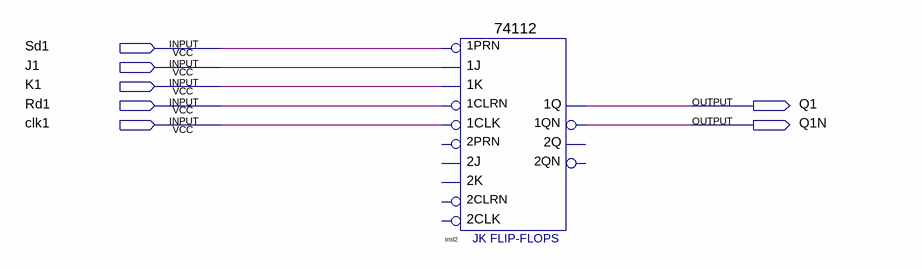
[diagram p0: schematic sheet]
// Quartus schematic exp5_t2_74112.bdf as structural Verilog: 1 symbols, 7 pins
module exp5_t2_74112 (
  input  Sd1,
  input  J1,
  input  K1,
  input  Rd1,
  input  clk1,
  output Q1,
  output Q1N
);

  \74112  inst2 (
    .\1K (K1), .\1J (J1), .\1PRN (Sd1), .\1CLK (clk1), .\1CLRN (Rd1), .\1QN (Q1N), .\1Q (Q1));  // open: 2K, 2J, 2PRN, 2CLK, 2CLRN, 2Q, 2QN
endmodule
